# EasyEDA Pro project wavie-main-board-v0.1.epro, board PCB2
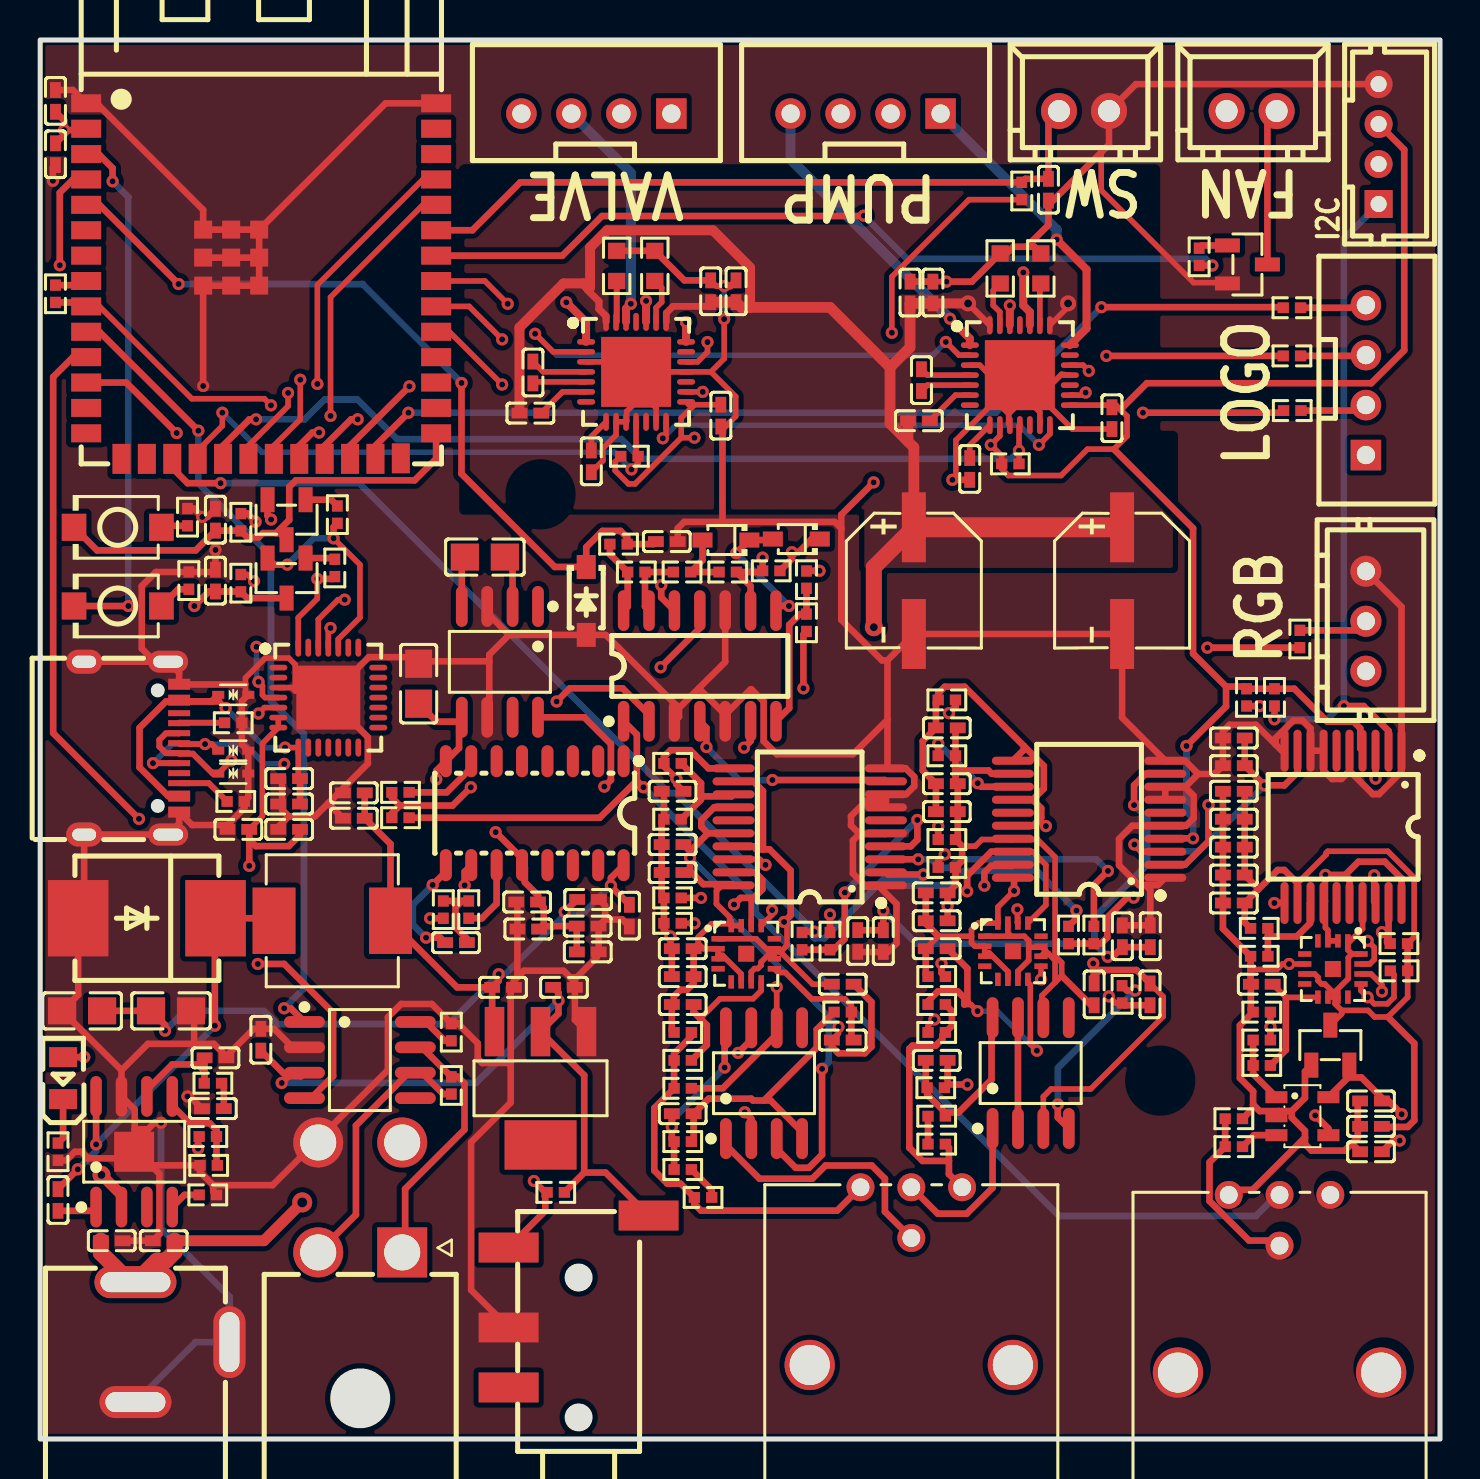
[diagram p1: board, top side]
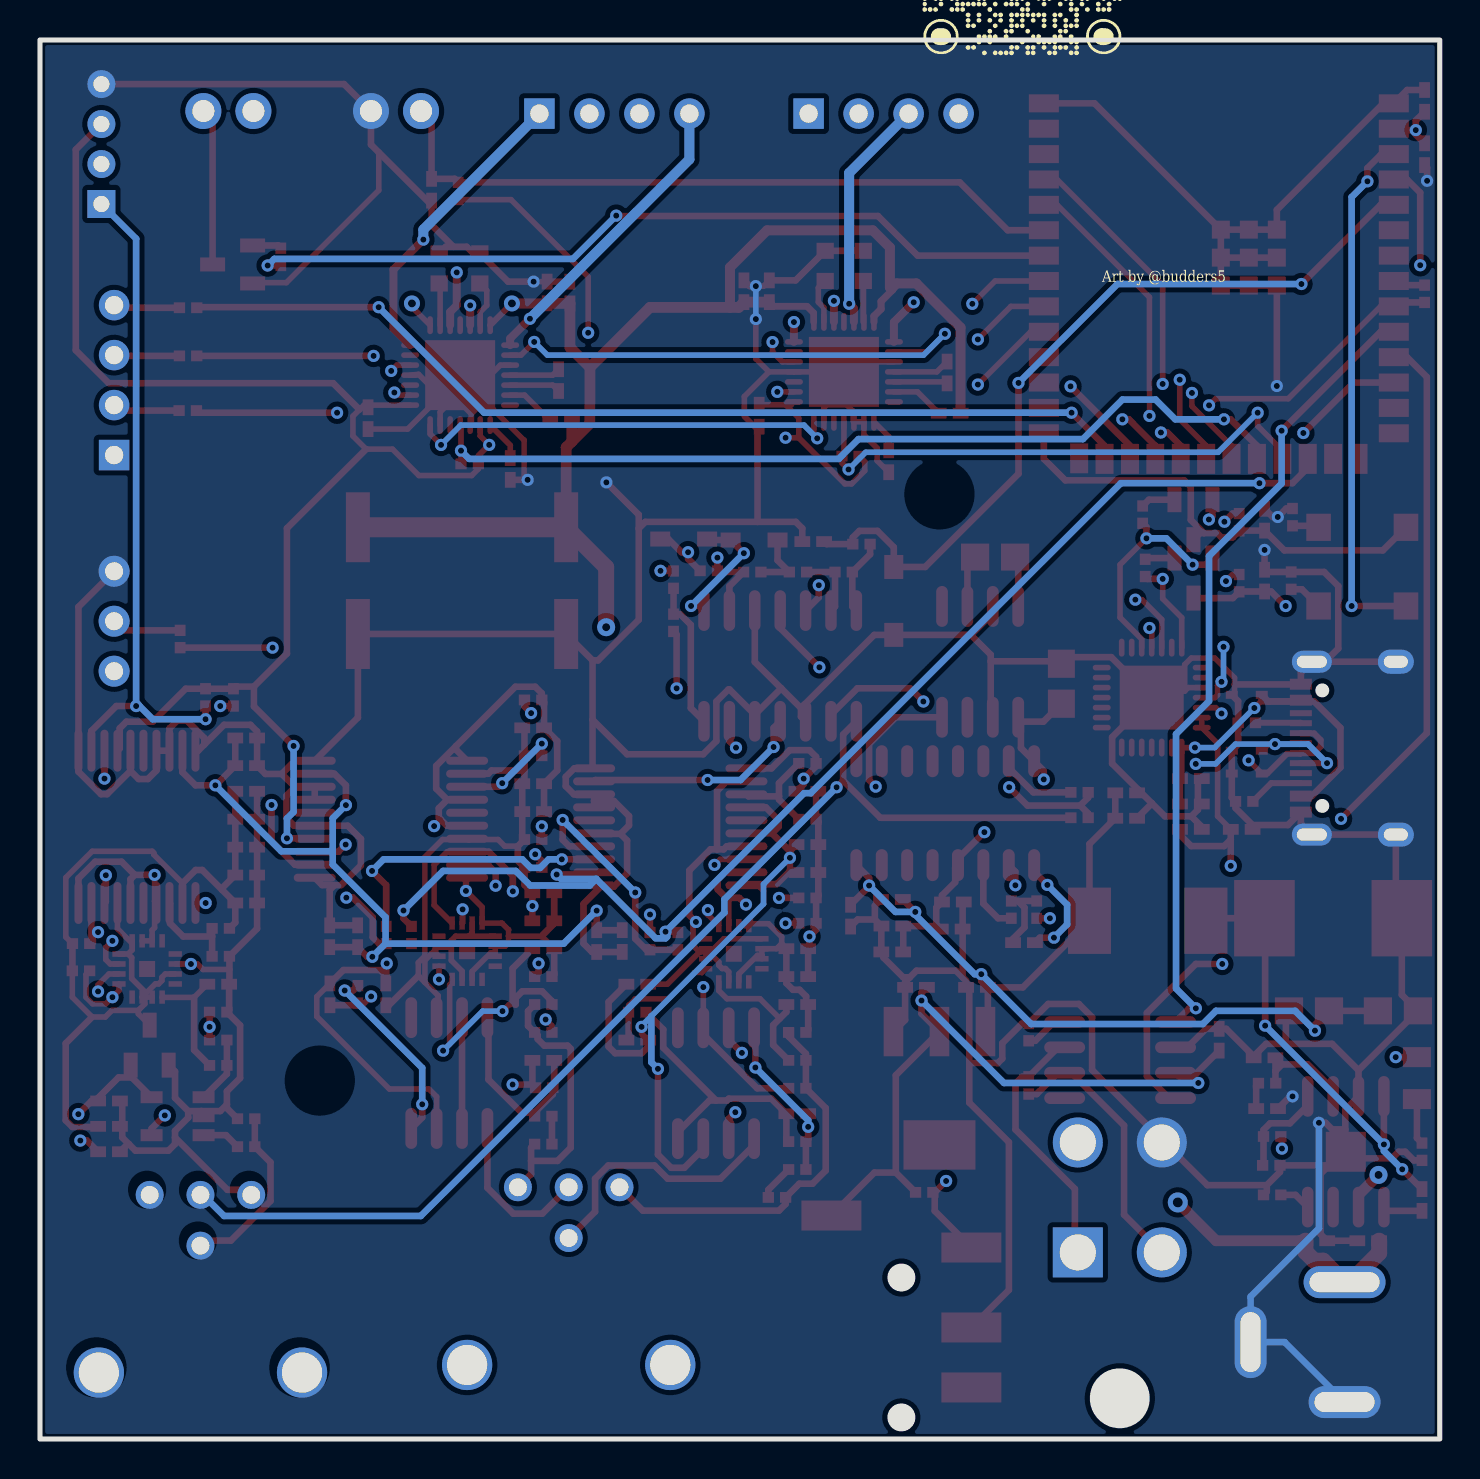
[diagram p2: board, bottom side, seen from below]

Outline 70 x 70 mm; copper layers: Top Layer, Inner1, Inner2, Bottom Layer. Coordinates in mm from the lower left corner of the outline.
Outline path: rectangle 0,70 70,0
Stack: Top Layer 0.035mm Outer layer thickness 1oz / Dielectric1 0.2104mm 7628 RC49% 8.6mil / Inner1 0.0152mm Inner layer thickness / Dielectric2 1.065mm 1.1mm H/HOZ Copper / Inner2 0.0152mm Inner layer thickness / Dielectric3 0.2104mm 7628 RC49% 8.6mil / Bottom Layer 0.035mm Outer layer thickness 1oz

## Design rules (mm)
template: Custom Config
spacing copperThickness1oz (default): track to track 0.102, other pairs 0.152 to 0.3
spacing copperThickness2oz: track to track 0.203, other pairs 0.152 to 0.3
spacing copperThicknessInner0.5oz: track to track 0.089, other pairs 0.152 to 0.3
track width copperThickness1oz (default): min 0.25, default 0.33, max 2.54
track width copperThickness2oz: min 0.5, default 0.5, max 2.54
track width copperThickness0.5oz: min 0.089, default 0.254, max 2.54
track width THIC: min 0.66, default 1, max 2.54
differential pair differentialPair (default): width min 0.127, default 0.254, max 2.54; gap min 0.152, default 0.152
via viaSize (default): diameter min 0.3, default 0.61, max 10; hole min 0.2, default 0.305, max 6.3
net GND uses GNDPOURTHERMAL
net VCC uses THIC, copperThickness2oz

## Placement (name value [footprint] x y rotation side)
Boot  SKRKAEE020  [SW-SMD_L3.9-W3.0-P4.45]  3.88 45.62 180 top
C1  100uF  [CAP-SMD_BD6.3-L6.6-W6.6-LS7.2-FD]  43.69 42.95 270 top
C2  100nF  [C0402]  33.53 57.43 270 top
C3  100nF  [C0402]  34.8 57.43 270 top
C4  22nF  [C0402]  24.64 53.36 270 top
C5  100nF  [C0402]  24.51 51.33 0 top
C7  100nF  [C0402]  34.04 51.2 90 top
C8  100uF  [CAP-SMD_BD6.3-L6.6-W6.6-LS7.2-FD]  54.1 42.95 270 top
C9  100nF  [C0402]  43.5 57.36 270 top
C10  100nF  [C0402]  44.64 57.36 270 top
C11  22nF  [C0402]  44.07 52.98 270 top
C12  100nF  [C0402]  43.94 50.95 0 top
C14  100nF  [C0402]  53.59 51.08 90 top
C16  100nF  [C0402]  0.76 66.95 270 top
C17  100nF  [C0402]  8.76 42.95 270 top
C18  100nF  [C0402]  8.76 46 270 top
C21  100nF  [C0402]  9.91 30.5 0 top
C22  100nF  [C0402]  12.45 31.77 0 top
C25  100nF  [C0402]  0.89 11.96 90 top
C26  39pF  [C0402]  8.76 19.07 180 top
C27  6.8nF  [C0402]  8.64 16.53 0 top
C36  100nF  [C0402]  11.03 19.98 270 top
C37  100nF  [C0402]  50.42 62.51 90 top
C42  100nF  [C0402]  27.4 27 180 top
C45  100nF  [C0402]  27.38 25.66 180 top
C47  100nF  [C0402]  15.68 31.06 0 top
C49  100nF  [C0402]  27.38 24.37 0 top
C55  100nF  [C0402]  42.16 24.91 90 top
C57  100nF  [C0402]  31.62 29.74 180 top
C59  100nF  [C0402]  31.62 32.41 180 top
C60  100nF  [C0402]  32.13 23.14 180 top
C61  100nF  [C0402]  32.13 24.53 180 top
C64  100nF  [C0402]  40.13 22.76 180 top
C65  1nF  [C0402]  32.13 16.28 0 top
C66  4.7uF  [C0402]  27.56 48.92 90 top
C67  4.7uF  [C0402]  46.48 48.54 90 top
C68  1.5nF  [C0402]  20.79 24.84 0 top
C69  20pF  [C0402]  31.33 44.9 180 top
C70  10nF  [C0402]  66.55 16.91 180 top
C71  10nF  [C0402]  61.09 22.76 0 top
C72  10uF  [C0402]  0.76 64.28 90 top
C73  10uF  [C0402]  12.45 30.5 0 top
C74  10uF  [C0402]  12.45 33.04 0 top
C75  10uF  [C0402]  26.19 22.6 180 top
C76  10uF  [C0402]  23.14 22.6 180 top
C77  10uF  [C0402]  29.46 26.18 90 top
C78  10uF  [C0402]  24.35 26.87 180 top
C79  10uF  [C0402]  15.68 32.33 0 top
C80  10uF  [C0402]  31.62 28.34 180 top
C81  10uF  [C0402]  40.88 24.92 90 top
C83  10uF  [C0402]  24.41 25.52 180 top
C84  1uF  [C0402]  32.13 21.74 0 top
C85  1uF  [C0402]  40.13 19.96 0 top
C86  1uF  [C0402]  66.55 14.37 0 top
C87  1uF  [C0402]  66.55 15.64 0 top
C90  47uF  [C0805]  2.1 21.42 0 top
C91  47uF  [C0805]  6.54 21.42 180 top
C92  2.2uF  [C0402]  6.18 9.92 0 top
C93  2.2uF  [C0402]  3.58 9.92 180 top
C94  100uF  [C0805]  18.92 37.79 270 top
C95  100uF  [C0805]  22.24 44.13 0 top
C96  100nF  [C0402]  54.12 25.16 270 top
C97  100nF  [C0402]  45.34 32.79 0 top
C98  100nF  [C0402]  45.34 35.58 0 top
C99  100nF  [C0402]  44.83 25.93 0 top
C100  100nF  [C0402]  44.83 27.33 0 top
C101  100nF  [C0402]  52.7 22.25 270 top
C102  1nF  [C0402]  44.83 18.95 0 top
C103  10uF  [C0402]  45.34 31.39 0 top
C104  10uF  [C0402]  55.51 25.16 270 top
C105  1uF  [C0402]  44.83 24.53 0 top
C106  1uF  [C0402]  55.5 22.25 270 top
C107  100nF  [C0402]  59.69 35.07 0 top
C108  100nF  [C0402]  59.69 28.22 0 top
C109  100nF  [C0402]  59.69 29.61 0 top
C110  100nF  [C0402]  59.69 31.01 0 top
C111  100nF  [C0402]  59.69 32.41 0 top
C114  10uF  [C0402]  59.69 26.82 0 top
C115  10uF  [C0402]  59.69 33.69 0 top
D1  LESD5D5.0CT1G  [SOD-523_L1.2-W0.8-LS1.6-BI]  9.65 33.3 180 top
D2  LESD5D5.0CT1G  [SOD-523_L1.2-W0.8-LS1.6-BI]  9.65 34.44 180 top
D3  LESD5D5.0CT1G  [SOD-523_L1.2-W0.8-LS1.6-BI]  9.65 37.23 180 top
D4  B560C-13-F  [SMC_L7.1-W6.2-LS8.1-RD]  5.33 26.06 180 top
D5  1N4148WS  [SOD-323_L1.8-W1.3-LS2.5-RD]  34.29 44.98 180 top
D6  1N4148WS  [SOD-323_L1.8-W1.3-LS2.5-RD]  37.81 45.03 180 top
D7  1N5819W  [SOD-123_L2.7-W1.6-LS3.7-RD-1]  27.3 41.93 270 top
DC1  PJ-002A  [DC-IN-TH_PJ-002A]  7.11 4.85 90 top
L1  10uH  [IND-SMD_L7.1-W6.6]  14.61 25.93 0 top
LED1  SZYY0805G  [LED0805-R-RD]  1.14 18.06 90 top
Q1  MMBT9014C  [SOT-23-3_L2.9-W1.3-P1.90-LS2.4-BR]  12.32 43.08 90 top
Q2  MMBT9014C  [SOT-23-3_L2.9-W1.3-P1.90-LS2.4-BR]  12.32 46 90 top
Q3  IRLML2502  [SOT-23-3_L2.9-W1.3-P1.90-LS2.4-BR]  60.37 58.77 180 top
R5  10kΩ  [R0402]  14.73 43.58 90 top
R6  10kΩ  [R0402]  14.86 46.25 90 top
R7  10kΩ  [R0402]  10.03 42.82 90 top
R8  1kΩ  [R0402]  7.43 42.95 270 top
R9  10kΩ  [R0402]  10.03 45.87 90 top
R10  1kΩ  [R0402]  7.37 46.12 270 top
R11  5.1kΩ  [R0402]  9.78 31.9 180 top
R12  5.1kΩ  [R0402]  9.65 35.84 180 top
R13  1kΩ  [R0402]  0.76 57.3 90 top
R14  10kΩ  [R0402]  29.46 49.17 180 top
R15  10kΩ  [R0402]  48.51 48.79 180 top
R16  100kΩ  [R0402]  8.38 12.21 180 top
R17  13kΩ  [R0402]  8.64 17.8 180 top
R18  270kΩ  [R0402]  8.38 15.14 180 top
R19  51kΩ  [R0402]  8.42 13.69 0 top
R32  10kΩ  [R0402]  20.56 20.36 90 top
R34  10kΩ  [R0402]  49.09 62.44 270 top
R35  100kΩ  [R0402]  57.96 59.15 270 top
R41  100kΩ  [R0402]  21.43 26.49 270 top
R42  10kΩ  [R0402]  20.16 26.49 90 top
R51  10kΩ  [R0402]  28.92 44.78 0 top
R53  10kΩ  [R0402]  39.49 24.91 270 top
R54  10kΩ  [R0402]  38.1 24.91 270 top
R55  10kΩ  [R0402]  31.62 33.8 0 top
R56  30kΩ  [R0402]  31.62 31.01 180 top
R57  10kΩ  [R0402]  31.62 27.07 180 top
R58  10kΩ  [R0402]  31.62 25.8 180 top
R59  10kΩ  [R0402]  32.13 18.95 180 top
R60  10kΩ  [R0402]  40.13 21.36 180 top
R61  100kΩ  [R0402]  32.13 13.48 180 top
R62  51kΩ  [R0402]  33.15 12.09 0 top
R63  51kΩ  [R0402]  18.02 32.36 180 top
R64  10kΩ  [R0402]  32.13 17.55 180 top
R65  10kΩ  [R0402]  32.13 20.34 180 top
R66  1MΩ  [R0402]  32.13 14.88 0 top
R68  4.02kΩ  [R0402]  0.89 14.37 90 top
R69  120Ω  [R0402]  20.56 17.69 90 top
R70  8.2kΩ  [R0402]  61.09 21.36 0 top
R71  300kΩ  [R0402]  61.09 19.96 180 top
R72  4.7kΩ  [R0402]  59.69 14.63 0 top
R73  7.5kΩ  [R0402]  59.69 16.02 180 top
R74  220Ω  [R0402]  61.09 18.69 0 top
R75  2kΩ  [R0402]  18.02 31.09 0 top
R81  820Ω  [R0402]  38.32 40.84 90 top
R82  4.7kΩ  [R0402]  25.78 12.34 0 top
R83  110mΩ  [R0603]  48.01 58.57 90 top
R84  110mΩ  [R0603]  50.04 58.57 90 top
R85  110mΩ  [R0603]  28.83 58.7 90 top
R86  110mΩ  [R0603]  30.73 58.7 90 top
R87  10kΩ  [R0402]  52.69 25.22 270 top
R88  10kΩ  [R0402]  51.42 25.22 270 top
R89  10kΩ  [R0402]  45.34 36.98 0 top
R90  30kΩ  [R0402]  45.34 34.19 0 top
R91  10kΩ  [R0402]  45.34 29.99 0 top
R92  10kΩ  [R0402]  45.34 28.6 0 top
R93  10kΩ  [R0402]  44.83 21.74 0 top
R94  10kΩ  [R0402]  54.1 22.25 90 top
R95  100kΩ  [R0402]  44.83 16.15 0 top
R96  51kΩ  [R0402]  44.83 14.75 180 top
R97  10kΩ  [R0402]  44.83 20.34 0 top
R98  10kΩ  [R0402]  44.83 23.14 180 top
R100  200kΩ  [R0402]  44.79 17.58 0 top
R101  10kΩ  [R0402]  60.33 37.11 90 top
R102  10kΩ  [R0402]  61.72 37.11 90 top
R103  10kΩ  [R0402]  60.96 24.15 0 top
R104  30kΩ  [R0402]  60.96 25.55 180 top
R105  10kΩ  [R0402]  67.95 24.79 0 top
R106  10kΩ  [R0402]  67.95 23.43 0 top
R107  470Ω  [R0402]  62.99 40.03 90 top
R108  36kΩ  [R0402]  38.32 43 90 top
R109  36kΩ  [R0402]  36.56 43.44 0 top
R110  36kΩ  [R0402]  34.38 43.38 180 top
R111  36kΩ  [R0402]  32.1 43.38 180 top
R112  36kΩ  [R0402]  29.81 43.38 180 top
R113  100Ω  [R0402]  62.59 54.19 0 top
R114  100Ω  [R0402]  62.59 56.6 0 top
R115  150Ω  [R0402]  62.61 51.46 0 top
Reset  SKRKAEE020  [SW-SMD_L3.9-W3.0-P4.45]  3.88 41.68 180 top
U1  ESP32-S3-WROOM-1-N16R8  [WIRELM-SMD_ESP32-S3-WROOM-1]  11.05 57.93 0 top
U2  TMC2209-LA  [QFN-28_L5.0-W5.0-P0.50-BL-EP]  29.8 53.39 270 top
U3  TMC2209-LA  [QFN-28_L5.0-W5.0-P0.50-BL-EP]  48.99 53.23 270 top
U4  TPS54360DDAR  [SOIC-8_L5.0-W4.0-P1.27-LS6.0-BL-EP2.0]  4.7 14.37 0 top
U5  AMS1117-3.3  [SOT-223-4_L6.5-W3.5-P2.30-LS7.0-BR]  25.02 17.55 90 top
U7  B4B-XH-A-G  [CONN-TH_B4B-XH-A-G]  27.81 66.32 180 top
U8  CP2102-GMR  [WQFN-28_L5.0-W5.0-P0.50-BL-EP3.2]  14.41 37.1 270 top
U9  B4B-XH-A-G  [CONN-TH_B4B-XH-A-G]  41.27 66.32 180 top
U11  SN65HVD230DR  [SOIC-8_L4.9-W3.9-P1.27-LS6.0-BL]  15.99 18.96 270 top
U12  B2B-XH-A  [CONN-TH_XH-2A]  52.2 66.44 0 top
U13  B2B-XH-A  [CONN-TH_XH-2A]  60.58 66.44 0 top
U14  B4B-PH-K-S-GW  [CONN-TH_B4B-PH-K-S-GW]  66.93 64.79 90 top
U15  1724480004  [CONN-TH_4P-P4.20_1724480004]  16 12.09 0 top
U16  031-6575  [CONN_6575_AMP]  43.56 12.6 0 top
U17  TP5551-TR  [SOT-23-5_L3.0-W1.7-P0.95-LS2.8-BR]  63.12 16.15 180 top
U18  XC6206P302MR  [SOT-23-3_L2.9-W1.3-P1.90-LS2.4-BR]  64.52 19.71 270 top
U19  CD4060BM  [SOP-16_L9.9-W3.9-P1.27-LS6.1-BL]  24.73 31.31 180 top
U20  LM2660M  [SOIC-8_L4.9-W3.9-P1.27-LS6.0-BL]  22.99 38.88 180 top
U22  TL074IM/TR  [SOIC-14_L8.6-W3.9-P1.27-LS6.0-BL]  32.98 38.68 0 top
U23  031-6575  [CONN_6575_AMP]  61.98 12.21 0 top
U24  KH-PJ-320D-SMT  [AUDIO-SMD_KH-PJ-320D-SMT_1]  26.92 6.88 90 top
U26  LMP7721MAX/NOPB  [SOIC-8_L4.9-W3.9-P1.27-LS6.0-BL]  36.2 17.8 0 top
U27  ADS1119IRTER  [WQFN-16_L3.0-W3.0-P0.50-BL-EP0.8]  35.31 24.28 270 top
U28  ADM3260ARSZ  [SSOP-20_L7.5-W5.2-P0.65-LS8.0-TL]  38.48 30.63 180 top
U29  LMP7721MAX/NOPB  [SOIC-8_L4.9-W3.9-P1.27-LS6.0-BL]  49.53 18.31 0 top
U30  ADS1119IRTER  [WQFN-16_L3.0-W3.0-P0.50-BL-EP0.8]  48.64 24.41 270 top
U31  ADM3260ARSZ  [SSOP-20_L7.5-W5.2-P0.65-LS8.0-TL]  52.45 31.01 180 top
U33  ADS1119IRTER  [WQFN-16_L3.0-W3.0-P0.50-BL-EP0.8]  64.64 23.52 180 top
U34  ADM3260ARSZ  [SSOP-20_L7.5-W5.2-P0.65-LS8.0-TL]  65.15 30.63 270 top
U35  B3B-XH-A(LF)(SN)  [CONN-TH_3P-P2.50_A2501WV2-3P]  66.29 40.92 90 top
U36  B4B-XH-A-G  [CONN-TH_B4B-XH-A-G]  66.29 52.98 90 top
USB1  TYPE-C 16PIN 2MD(073)  [USB-C-SMD_TYPE-C-6PIN-2MD-073]  4.57 34.57 270 top

## Footprints (pads in the part's own frame, mm; a bottom-side part is the same pattern mirrored in y, then rotated)
AUDIO-SMD_KH-PJ-320D-SMT_1
  rect 1.5x3 smd: 1(4.3,-3.5) 2(-4.3,3.5) 3(-1.3,3.5) 4(2.7,3.5)
C0402
  rect 0.79x0.54 smd: 1(-0.545,0) 2(0.545,0)
C0805
  rect 1.41x1.35 smd: 1(-1,0) 2(1,0)
CAP-SMD_BD6.3-L6.6-W6.6-LS7.2-FD
  rect 3.5x1.2 smd: 1(-2.67,0) 2(2.67,0)
CONN-TH_3P-P2.50_A2501WV2-3P
  round 1.55 hole 0.9: 1(-2.5,0) 2(0,0) 3(2.5,0)
CONN-TH_4P-P4.20_1724480004
  rect 2.5x2.5 hole 1.8: 1(2.1,-2.75)
  round 2.5 hole 1.8: 2(-2.1,-2.75) 3(2.1,2.75) 4(-2.1,2.75)
CONN-TH_B4B-PH-K-S-GW
  rect 1.4x1.4 hole 0.8: 1(-3,0)
  round 1.4 hole 0.8: 2(-1,0) 3(1,0) 4(3,0)
CONN-TH_B4B-XH-A-G
  rect 1.524x1.524 hole 0.914: 1(-3.75,0)
  round 1.524 hole 0.914: 2(-1.25,0) 3(1.25,0) 4(3.75,0)
CONN-TH_XH-2A
  round 1.8 hole 1.1: 1(-1.251,0) 2(1.251,0)
CONN_6575_AMP
  round 1.397 hole 0.889: 1(-2.54,0) 2(0,0) 3(2.54,0) 4(0,-2.54)
  round 2.514 hole 2.006: 5(-5.08,-8.89) 6(5.08,-8.89)
DC-IN-TH_PJ-002A
  oval 1.6x4.1 hole 1x3.5: 1(3,2.35)
  oval 1.6x3.6 hole 1x3: 2(-3,2.35)
  oval 3.6x1.6 hole 3x1: 3(0,-2.35)
IND-SMD_L7.1-W6.6
  rect 2.15x3.32 smd: 1(-2.913,0) 2(2.913,0)
LED0805-R-RD
  rect 1x1.399 smd: 1(1.05,0) 2(-1.05,0)
QFN-28_L5.0-W5.0-P0.50-BL-EP
  oval 0.28x0.9 smd: 1(-1.502,-2.5) 2(-1.001,-2.5) 3(-0.5,-2.5) 4(0,-2.5) 5(0.5,-2.5) 6(1,-2.5) 7(1.501,-2.5) 15(1.501,2.5) 16(1,2.5) 17(0.5,2.5) 18(0,2.5) 19(-0.5,2.5) 20(-1.001,2.5) 21(-1.502,2.5)
  oval 0.9x0.28 smd: 8(2.5,-1.502) 9(2.5,-1.001) 10(2.5,-0.5) 11(2.5,0) 12(2.5,0.5) 13(2.5,1) 14(2.5,1.501) 22(-2.5,1.501) 23(-2.5,1) 24(-2.5,0.5) 25(-2.5,0) 26(-2.5,-0.5) 27(-2.5,-1.001) 28(-2.5,-1.502)
  rect 3.5x3.5 smd: 29(0,0)
R0402
  rect 0.566x0.54 smd: 1(-0.433,0) 2(0.433,0)
R0603
  rect 0.806x0.864 smd: 1(-0.753,0) 2(0.753,0)
SMC_L7.1-W6.2-LS8.1-RD
  rect 3.03x3.82 smd: 1(-3.435,0) 2(3.435,0)
SOD-123_L2.7-W1.6-LS3.7-RD-1
  rect 1.2x0.95 smd: 1(-1.7,0) 2(1.7,0)
SOD-323_L1.8-W1.3-LS2.5-RD
  rect 1x0.75 smd: 1(-1.173,0) 2(1.173,0)
SOD-523_L1.2-W0.8-LS1.6-BI
  rect 0.6x0.4 smd: 1(-0.75,0) 2(0.75,0)
SOIC-8_L4.9-W3.9-P1.27-LS6.0-BL
  oval 0.588x2.045 smd: 1(-1.905,-2.772) 2(-0.635,-2.772) 3(0.635,-2.772) 4(1.905,-2.772) 5(1.905,2.772) 6(0.635,2.772) 7(-0.635,2.772) 8(-1.905,2.772)
SOIC-8_L5.0-W4.0-P1.27-LS6.0-BL-EP2.0
  oval 0.574x2.038 smd: 1(-1.905,-2.769) 2(-0.635,-2.769) 3(0.635,-2.769) 4(1.905,-2.769) 5(1.905,2.769) 6(0.635,2.769) 7(-0.635,2.769) 8(-1.905,2.769)
  rect 2x2 smd: 9(0,0)
SOIC-14_L8.6-W3.9-P1.27-LS6.0-BL
  oval 0.574x2.038 smd: 1(-3.81,-2.769) 2(-2.54,-2.769) 3(-1.27,-2.769) 4(0,-2.769) 5(1.27,-2.769) 6(2.54,-2.769) 7(3.81,-2.769) 8(3.81,2.769) 9(2.54,2.769) 10(1.27,2.769) 11(0,2.769) 12(-1.27,2.769) 13(-2.54,2.769) 14(-3.81,2.769)
SOP-16_L9.9-W3.9-P1.27-LS6.1-BL
  oval 0.6x1.6 smd: 1(-4.445,-2.6) 2(-3.175,-2.6) 3(-1.905,-2.6) 4(-0.635,-2.6) 5(0.635,-2.6) 6(1.905,-2.6) 7(3.175,-2.6) 8(4.445,-2.6) 9(4.445,2.6) 10(3.175,2.6) 11(1.905,2.6) 12(0.635,2.6) 13(-0.635,2.6) 14(-1.905,2.6) 15(-3.175,2.6) 16(-4.445,2.6)
SOT-23-3_L2.9-W1.3-P1.90-LS2.4-BR
  rect 1.25x0.7 smd: 1(1,-0.95) 2(1,0.95) 3(-1,0)
SOT-23-5_L3.0-W1.7-P0.95-LS2.8-BR
  rect 1.1x0.6 smd: 1(1.3,-0.95) 2(1.3,0) 3(1.3,0.95) 4(-1.3,0.95) 5(-1.3,-0.95)
SOT-223-4_L6.5-W3.5-P2.30-LS7.0-BR
  rect 2.47x0.98 smd: 1(2.835,-2.3) 2(2.835,0) 3(2.835,2.3)
  rect 2.47x3.6 smd: 4(-2.835,0)
SSOP-20_L7.5-W5.2-P0.65-LS8.0-TL
  oval 2.1x0.4 smd: 1(-3.81,2.926) 2(-3.81,2.276) 3(-3.81,1.625) 4(-3.81,0.976) 5(-3.81,0.325) 6(-3.81,-0.325) 7(-3.81,-0.976) 8(-3.81,-1.625) 9(-3.81,-2.276) 10(-3.81,-2.926) 11(3.81,-2.926) 12(3.81,-2.276) 13(3.81,-1.625) 14(3.81,-0.976) 15(3.81,-0.325) 16(3.81,0.325) 17(3.81,0.976) 18(3.81,1.625) 19(3.81,2.276) 20(3.81,2.926)
SW-SMD_L3.9-W3.0-P4.45
  rect 1.23x1.36 smd: 1(-2.185,0) 2(2.185,0)
USB-C-SMD_TYPE-C-6PIN-2MD-073
  rect 0.55x1.1 smd: 1(-3.2,2.375) 2(-2.4,2.375) 11(2.4,2.375) 12(3.2,2.375)
  rect 0.3x1.1 smd: 3(-1.75,2.375) 4(-1.25,2.375) 5(-0.75,2.375) 6(-0.25,2.375) 7(0.25,2.375) 8(0.75,2.375) 9(1.25,2.375) 10(1.75,2.375)
  oval 1.1x2 hole 0.6x1.5: 13(-4.325,1.825) 14(4.325,1.825)
  oval 1.2x1.8 hole 0.6x1.2: 13(-4.325,-2.375) 14(4.325,-2.375)
WIRELM-SMD_ESP32-S3-WROOM-1
  rect 1.5x0.9 smd: 1(-8.75,8.895) 2(-8.75,7.625) 3(-8.75,6.355) 4(-8.75,5.085) 5(-8.75,3.815) 6(-8.75,2.545) 7(-8.75,1.275) 8(-8.75,0.005) 9(-8.75,-1.265) 10(-8.75,-2.535) 11(-8.75,-3.805) 12(-8.75,-5.075) 13(-8.75,-6.345) 14(-8.75,-7.615) 27(8.75,-7.615) 28(8.75,-6.345) 29(8.75,-5.075) 30(8.75,-3.805) 31(8.75,-2.535) 32(8.75,-1.265) 33(8.75,0.005) 34(8.75,1.275) 35(8.75,2.545) 36(8.75,3.815) 37(8.75,5.085) 38(8.75,6.355) 39(8.75,7.625) 40(8.75,8.895)
  rect 0.9x1.5 smd: 15(-6.985,-8.895) 16(-5.715,-8.895) 17(-4.445,-8.895) 18(-3.175,-8.895) 19(-1.905,-8.895) 20(-0.635,-8.895) 21(0.635,-8.895) 22(1.905,-8.895) 23(3.175,-8.895) 24(4.445,-8.895) 25(5.715,-8.895) 26(6.985,-8.865)
  rect 0.9x0.9 smd: 41(-2.9,2.575) 41(-2.9,1.175) 41(-2.9,-0.225) 41(-1.5,2.575) 41(-1.5,1.175) 41(-1.5,-0.225) 41(-0.1,2.575) 41(-0.1,1.175) 41(-0.1,-0.225)
WQFN-16_L3.0-W3.0-P0.50-BL-EP0.8
  rect 0.28x0.665 smd: 1(-0.75,-1.407) 2(-0.25,-1.407) 3(0.25,-1.407) 4(0.75,-1.407) 9(0.75,1.407) 10(0.25,1.407) 11(-0.25,1.407) 12(-0.75,1.407)
  rect 0.665x0.28 smd: 5(1.407,-0.75) 6(1.407,-0.25) 7(1.407,0.25) 8(1.407,0.75) 13(-1.407,0.75) 14(-1.407,0.25) 15(-1.407,-0.25) 16(-1.407,-0.75)
  rect 0.8x0.8 smd: 17(0,0)
WQFN-28_L5.0-W5.0-P0.50-BL-EP3.2
  oval 0.28x0.9 smd: 1(-1.502,-2.5) 2(-1.001,-2.5) 3(-0.5,-2.5) 4(0,-2.5) 5(0.5,-2.5) 6(1,-2.5) 7(1.501,-2.5) 15(1.501,2.5) 16(1,2.5) 17(0.5,2.5) 18(0,2.5) 19(-0.5,2.5) 20(-1.001,2.5) 21(-1.502,2.5)
  oval 0.9x0.28 smd: 8(2.5,-1.502) 9(2.5,-1.001) 10(2.5,-0.5) 11(2.5,0) 12(2.5,0.5) 13(2.5,1) 14(2.5,1.501) 22(-2.5,1.501) 23(-2.5,1) 24(-2.5,0.5) 25(-2.5,0) 26(-2.5,-0.5) 27(-2.5,-1.001) 28(-2.5,-1.502)
  rect 3.2x3.2 smd: 29(0,0)

## Nets
As in the schematic.

Pads without a net: U1 6 7 15 16 26 28 29 30 38 39; U2 7 12 17 20 25; U3 7 12 17 20 25; U4 3; U5 4; U8 1 2 9 10 11 12 13 14 15 16 17 18 19 20 21 22 23 27; U11 5; U16 5 6; U19 1 2 3 4 5 6 13 14 15; U20 1 7; U23 5 6; U24 2; U26 5; U27 4 5 12 17; U28 6 15; U29 5; U30 4 5 12 17; U31 6 15; U33 4 5 8 12 17; U34 6 15; USB1 3 9

## Via types
v1: diameter 0.61, hole 0.305, Top Layer to Bottom Layer, 186 vias
v2: diameter 0.8, hole 0.4, Top Layer to Bottom Layer, 2 vias
v3: diameter 1, hole 0.5, Top Layer to Bottom Layer, 1 via
v4: diameter 0.9, hole 0.4, Top Layer to Bottom Layer, 2 vias

## Routing (per net, layer and track width the routed paths; a pad name or vN(x,y) marks a point on that pad's centre or on a via; arc(x,y) is an arc through that point)
+3.3V: length 282.2
  Top Layer w0.28: 32.06,50.1 32.06,51.09 32.72,51.75 ; 32.06,50.1 v1(32.72,50.1) ; 32.06,50.1 29.75,47.79 29.42,47.79 28.76,48.45 28.76,48.9 R14.2 ; 32.72,51.75 C7.2 ; 32.72,51.75 32.44,51.75 U2.15 ; 53.47,51.73 53.59,51.62 ; 53.47,51.73 U3.15 ; 53.47,51.73 53.8,51.73 54.35,51.18 54.35,50.19 53.69,49.53 52.37,49.53 51.05,48.21 48.41,48.21 48.08,48.54 R15.2 48.08,49.2 v1(47.54,49.74) 47.99,50.19 U3.9 ; U8.6 U8.7 11.11,34.8 11.11,31.16 C21.2 ; v1(42.59,55.35) 42.59,58.15 46.45,62.01 R34.2 ; v1(10.69,42.92) 10.36,43.25 R7.2
  Top Layer w0.33: v1(1.2,65.49) 2.23,65.49 U1.2 ; v1(1.2,65.49) 1.2,65.27 C72.2 ; v1(1.2,65.49) 1.2,65.97 C16.2 ; U34.4 66.01,34.55 66.01,35.56 65.68,35.89 64.36,35.89 62.71,37.54 R102.2 R101.2 60.22,37.65 59.3,37.65 ; 27.2,13.33 27.2,18.2 U5.2 25.92,21.28 v1(25.92,21.94) 25.92,22.33 C75.2 ; 27.2,13.33 28.27,13.33 U24.1 ; 27.2,13.33 R82.2 ; v1(12.08,17.81) 12.41,18.14 ; 12.41,18.14 12.32,18.14 C36.2 ; 12.41,18.14 13.03,18.14 U11.3 ; v1(43.86,30.97) 43.86,29.98 43.53,29.65 U28.4 ; 10.45,30 10.45,30.5 ; 10.45,30 v1(10.45,28.68) ; 10.45,30 10.78,29.67 12.43,29.67 12.99,30.22 C73.2 ; R54.2 R53.2 39.68,24.48 40.23,25.03 v1(40.23,27.34) ; v1(54.68,27.09) 54.35,27.09 53.36,26.1 53.36,25.11 53.04,24.78 R87.2 R88.2 ; U31.4 56.28,30.06 v1(57.65,30.06) ; 59.3,37.65 59.3,36.66 v1(57.32,34.68) ; 59.3,37.65 57.65,39.3 57.65,45.57 53.69,49.53 ; v1(2.2,19.11) LED1.1 ; v1(10.77,45.89) 10.36,46.3 R9.2 ; U14.3 68.21,64.51 68.21,54.48 66.56,52.83 55.34,52.83 54.02,51.51
  Inner1 w0.28: v1(42.59,55.35) 47.54,50.4 v1(47.54,49.74)
  Inner1 w0.33: v1(43.86,30.97) 44.19,30.97 44.52,31.3 47.82,31.3 52.04,27.09 v1(54.68,27.09) ; v1(10.69,42.92) 10.69,45.49 10.77,45.56 v1(10.77,45.89)
  Inner2 w0.28: v1(47.54,49.74) 46.55,50.73 33.35,50.73 v1(32.72,50.1) ; v1(10.69,42.92) 10.69,41.97 10.12,41.4 10.12,35.94 10.45,35.61 v1(10.45,28.68)
  Inner2 w0.33: v1(10.45,28.68) 10.45,27.69 10.12,27.36 10.12,19.44 10.45,19.11 ; v1(1.2,65.49) 1.2,64.39 9.78,55.81 9.78,46.88 v1(10.77,45.89) ; v1(40.23,27.34) 39.57,27.34 34.95,22.72 26.7,22.72 v1(25.92,21.94) ; 10.45,19.11 v1(2.2,19.11) ; 10.45,19.11 10.78,19.11 v1(12.08,17.81) ; v1(57.65,30.06) v1(54.68,27.09)
  Bottom Layer w0.33: v1(25.92,21.94) 21.79,17.81 v1(12.08,17.81) ; v1(57.32,34.68) 57.32,31.38 57.65,31.05 v1(57.65,30.06) ; v1(43.86,30.97) v1(40.23,27.34)
+3VDO: length 8
  Top Layer w0.33: 65.41,18.09 65.41,18.65 U18.2 ; 65.41,18.09 U17.5 ; 65.41,18.09 66.07,18.09 67.09,17.07 C70.1 67.42,16.91 v1(68.08,16.25) ; v1(67.98,14.93) 67.65,14.93 C86.2
  Inner2 w0.33: v1(68.08,16.25) 68.08,15.03 v1(67.98,14.93)
+5V: length 176.5
  Top Layer w0.33: C107.2 C115.2 61.22,32.71 ; v1(42.16,26.44) C55.2 40.89,25.46 ; U20.8 27.2,36.11 28.54,34.77 28.54,32.97 v1(28.21,32.64) ; U28.9 42.22,32.97 v1(36.61,32.97) ; v1(54.7,31.72) 54.7,32.71 55.28,33.29 U31.9 ; C77.2 28.54,27.65 v1(28.54,27.69) 28.54,28.08 U19.16 ; C90.2 C91.2 6.24,20.72 v1(6.24,20.43) ; C76.2 22.6,20.5 U5.3 ; C76.2 20.85,22.6 L1.2 17.52,29.77 C47.2 C79.2 ; C76.2 22.93,22.93 v1(22.93,23.26) ; C104.2 C96.2 53.63,24.13 v1(53.38,24.13) ; v1(7.89,14.53) 7.89,15.08 R18.2 ; v1(26.23,26.37) C42.2 ; U34.9 62.88,33.37 62.22,32.71 v1(61.23,32.71) ; U22.4 33.32,35.58 v1(33.32,34.62)
  Inner1 w0.33: v1(6.24,20.43) 6.24,17.13 7.23,16.14 7.23,15.19 v1(7.89,14.53)
  Inner2 w0.33: U35.1 66.19,38.32 65.85,38.32 ; 30.85,30 v1(28.21,32.64) ; 30.85,30 32.98,32.14 32.98,34.29 v1(33.32,34.62) ; 30.85,30 v1(28.54,27.69) ; v1(36.61,32.97) 42.16,27.43 v1(42.16,26.44) ; 65.85,38.32 61.23,33.7 v1(61.23,32.71) ; 65.85,38.32 65.19,38.98 65.19,47.23 66.18,48.22 66.18,49.21 ; 66.18,49.21 59.33,56.06 U13.1 ; 66.18,49.21 66.27,49.21 U36.1
  Bottom Layer w0.33: 52.72,24.79 43.81,24.79 v1(42.16,26.44) ; 52.72,24.79 v1(53.38,24.13) ; 52.72,24.79 52.72,26.11 55.36,28.75 55.36,29.41 ; v1(6.24,20.43) 7.23,21.42 11.19,21.42 11.85,20.76 20.43,20.76 v1(22.93,23.26) 23.26,23.26 26.23,26.23 v1(26.23,26.37) 27.22,26.37 v1(28.54,27.69) ; v1(61.23,32.71) 57.93,29.41 55.36,29.41 ; v1(36.61,32.97) 34.96,32.97 v1(33.32,34.62) ; 55.36,29.41 55.36,31.06 v1(54.7,31.72)
GND: length 512.9
  Top Layer w0.28: D3.1 10.26,37.37 10.26,38.09 11.25,39.08 12.43,39.08 12.76,38.75 12.76,37.43 ; 30.65,53.39 U2.18 33.54,53.39 ; 30.65,53.39 30.65,51.74 ; 30.65,53.39 U2.29 29.3,53.89 U2.3 ; 47.44,51.62 48.1,51.62 48.43,51.29 ; 47.44,51.62 45.79,49.97 45.79,47.99 ; 47.44,51.62 47.44,53.27 46.98,53.73 U3.3 ; C66.1 28.14,48.95 28.14,49.57 28.8,50.23 U2.9 U2.10 29.33,50.92 29.33,51.41 29.66,51.74 30.65,51.74 ; 50.52,52.73 49.75,51.95 49.75,51.62 ; 50.52,52.73 51.07,53.27 U3.18 ; 50.52,52.73 50.52,51.62 51.61,50.53 C14.1 ; 34.12,50.51 34.78,51.17 34.78,52.16 33.54,53.39 ; 49.09,51.62 49.75,51.62 ; 49.09,51.62 48.76,51.62 48.43,51.29 ; 49.09,51.62 49.09,53.13 U3.29 ; 49.75,51.62 49.99,51.38 U3.13 ; 30.65,51.74 30.8,51.59 30.8,50.89 ; U3.10 48.43,50.79 48.43,51.29 ; v1(45.32,57.91) C10.1 ; 33.54,53.39 34.2,54.05 v1(34.2,56.03) ; 12.76,37.43 14.08,37.43 U8.29 ; 12.76,37.43 12.59,37.6 U8.3 ; 53.06,64.38 53.06,62.48 57.68,57.86 59.33,57.86 Q3.2 ; C2.1 33.82,57.68 v1(34.2,57.68)
  Top Layer w0.33: U11.2 12.62,19.6 11.69,20.52 C36.1 10.68,20.52 9.31,19.15 ; 40.06,45.56 39.73,45.89 34.12,45.89 ; 40.06,45.56 40.06,46.24 v1(41.68,47.86) ; 40.06,45.56 40.06,40.99 42.09,38.96 42.37,38.96 ; v1(8.15,52.69) U1.41 U1.41 U1.41 U1.41 ; 27.93,25.66 C49.2 27.82,24.27 27.82,24.09 26.83,23.1 26.5,23.1 ; U5.1 26.74,20.97 C75.1 26.74,22.87 26.5,23.1 ; 13.76,14.84 17.39,18.47 17.39,21.11 18.05,21.77 19.58,21.77 20.56,20.79 20.89,20.79 21.88,19.8 21.88,19.03 22.1,18.81 23.53,18.81 ; 13.76,14.84 11.62,12.7 8.65,12.7 ; 13.76,14.84 U15.4 ; 41.96,27.64 42.82,26.77 42.82,24.79 42.39,24.37 C55.1 40.89,24.37 ; 41.96,27.64 41.3,27.64 40.64,28.3 40.64,29.95 40.97,30.28 ; 41.96,27.64 U28.1 ; U1.41 U1.41 ; U1.41 U1.41 U1.41 ; U1.41 17.27,66.83 U1.40 ; U1.41 U1.41 U1.41 8.15,61.5 2.87,66.78 2.35,66.78 U1.1 1.63,67.5 C16.1 ; U24.3 21.55,7.46 21.55,14.85 23.53,16.83 23.53,18.81 ; 4.72,15.49 5.38,15.49 5.71,15.82 v1(6.04,15.82) ; 4.72,15.49 4.72,14.5 ; 4.72,15.49 4.72,16.48 4.06,17.14 4.07,18.45 ; 23.45,40.23 22.35,41.33 U20.3 ; 23.45,40.23 22.46,39.24 22.46,38.91 ; 23.45,40.23 D7.2 28.28,40.23 31.95,36.57 ; C27.1 7.48,17.14 v1(7.36,17.14) ; 15.07,32.48 15.07,32.4 C79.1 ; 15.07,32.48 16.39,33.8 16.39,35.12 U8.29 16.43,39.12 18.7,39.12 19.03,38.79 ; 15.07,32.48 14.41,31.82 ; R10.1 7.68,46.56 v1(8.1,46.13) 8.36,46.13 C18.1 ; 26.5,23.1 26.17,23.43 24.19,23.43 23.86,23.1 ; 34.26,36.24 35.52,37.5 35.58,37.5 36.18,36.9 36.18,34.92 36.84,34.26 40.64,34.26 42.37,35.99 ; 34.26,36.24 32.93,37.56 ; 34.26,36.24 U22.5 ; 5.54,13.69 5.38,13.69 U4.9 ; 5.54,13.69 7.99,13.69 7.99,13.36 8.65,12.7 ; 5.54,13.69 4.72,14.5 ; 5.54,13.69 5.96,13.27 5.96,10.25 C92.1 C93.1 ; 65.48,33.43 65.48,34.44 ; 65.48,33.43 66.64,32.26 66.95,32.26 68.08,33.39 U34.1 68.08,41.63 U35.3 ; 65.48,33.43 65.07,33.02 64.6,33.02 64.18,33.45 U34.7 U34.8 63.53,35.55 63.13,35.95 62.66,35.95 61.79,35.07 61.79,34.74 ; C45.1 28.25,25.99 ; 28.25,25.99 28.25,26.69 C42.1 ; 28.25,25.99 29.11,25.99 C77.1 ; 23.53,18.81 23.53,22.44 C76.1 23.69,22.93 23.86,23.1 ; 9.31,19.15 8.69,19.77 7.7,19.77 ; 9.31,19.15 C26.1 ; 57.91,33.28 57.25,32.62 ; 57.91,33.28 58.73,33.28 59.15,33.69 C107.1 59.14,35.4 59.48,35.73 60.8,35.73 61.79,34.74 ; 57.91,33.28 57.25,33.94 U31.10 54.1,36.1 C8.2 C1.2 42.37,38.96 ; 57.25,32.62 57.68,32.19 57.68,31.06 57.3,30.69 U31.5 54.61,30.69 53.95,30.03 53.95,28.71 54.94,27.72 55.27,27.72 ; 57.25,32.62 56.28,32.62 U31.8 U31.7 ; D3.1 10.09,36.92 R12.1 10.09,34.76 D2.1 D1.1 10.4,32.09 R11.1 10.21,31.57 9.36,30.72 ; R16.1 8.65,12.38 8.65,12.7 ; 31.95,36.57 31.95,36.14 U22.3 ; 31.95,36.57 32.93,37.56 ; 42.29,31.93 41.3,31.93 40.54,31.17 40.54,30.7 40.97,30.28 ; 42.29,31.93 U28.7 ; 42.29,31.93 U28.8 43.3,32.26 43.71,32.66 43.71,33.13 43.28,33.56 U28.10 42.37,33.63 42.37,35.99 ; 50.42,61.74 53.45,64.77 U12.2 54.8,67.79 U14.4 ; 50.42,61.74 C37.1 ; 50.42,61.74 50.42,60.75 49.33,59.65 ; 4.72,14.5 U4.9 ; U4.9 4.37,14.04 2.39,14.04 2.06,14.37 1.73,14.37 1.3,13.94 R68.1 ; 5.74,38.89 USB1.13 6.95,38.34 USB1.1 6.96,37.76 10.26,37.76 ; 5.74,38.89 5.08,39.55 5.08,42.68 5.78,43.38 8.65,43.38 C17.1 v1(8.76,44.48) ; 5.74,38.89 USB1.13 ; C96.1 C104.1 55.51,27.47 55.27,27.72 ; C78.2 23.86,26.81 23.86,23.1 ; 9.36,30.72 C21.1 ; 9.36,30.72 7.59,30.72 USB1.12 6.95,30.79 USB1.14 USB1.14 2.2,26.36 D4.2 1.9,22.23 C90.1 4.07,18.45 ; 34.12,45.89 32.2,45.89 31.88,45.56 C69.1 ; 34.12,45.89 34.12,50.58 C7.1 ; 61.79,34.74 62.09,34.44 U34.10 ; U20.6 22.46,36.22 22.46,38.91 ; 14.41,31.82 14.41,31.79 C47.1 ; 14.41,31.82 13.75,31.16 12.43,31.16 ; v1(45.61,47.99) C67.1 ; 7.7,19.77 5.39,19.77 4.07,18.45 ; 7.7,19.77 7.7,21.27 C91.1 ; v1(45.32,57.91) 46.59,57.91 R83.2 48.34,59.32 48.67,59.65 49.33,59.65 ; 55.27,27.72 55.89,27.72 U31.1 ; 49.33,59.65 49.71,59.65 R84.2 ; 22.46,38.91 19.16,38.91 19.03,38.79 ; C72.1 0.64,63.61 v1(0.64,62.95) ; 12.1,31.82 12.1,32.85 C74.1 ; 12.1,31.82 C22.1 ; 12.1,31.82 12.1,31.49 12.43,31.16 ; 40.97,30.28 42.26,30.28 U28.5 ; 32.93,37.56 34.26,38.88 U22.10 ; 42.37,35.99 42.37,38.96 ; C10.1 C9.1 ; 12.43,31.16 11.9,30.63 C73.1 ; C3.1 34.51,57.68 v1(34.2,57.68) ; R85.2 R86.2 32.21,57.97 C2.1 ; 19.03,38.79 C94.1
  Inner1 w0.33: v1(0.64,62.95) 8.15,55.44 v1(8.15,52.69)
  Inner2 w0.28: v1(34.2,57.68) 44.1,57.68 44.33,57.91 v1(45.32,57.91)
  Inner2 w0.33: v1(8.15,52.69) 8.15,51.37 8.76,50.75 8.76,50.42 8.1,49.76 v1(8.1,46.13) 8.76,45.47 v1(8.76,44.48) ; v1(6.04,15.82) v1(7.36,17.14) ; v1(41.68,47.86) 45.49,47.86 v1(45.61,47.99)
  Bottom Layer w0.28: v1(34.2,56.03) v1(34.2,57.68)
  Bottom Layer w0.33: v1(6.04,15.82) 6.04,10.54 9.46,7.12 DC1.3 7.76,4.85 4.76,1.85
VBUS: length 19.3
  Top Layer w0.28: v1(12.24,34.6) U8.8 12.9,33.13 C74.2 ; D3.2 8.94,36.91 v1(9.27,36.58)
  Top Layer w0.33: 8.94,36.91 8.57,36.91 ; 8.57,36.91 7.01,36.91 USB1.2 ; 8.57,36.91 D3.2 ; 8.57,36.9 6.29,36.9 4.97,35.58 4.97,33.6 6.4,32.17 USB1.11 ; C22.2 C74.2
  Bottom Layer w0.28: v1(12.24,34.6) 11.25,34.6 v1(9.27,36.58)
VCC: length 146.1
  Top Layer w0.28: U3.22 51.4,56.64 v2(51.4,56.82)
  Top Layer w0.31: v2(46.4,56.82) U3.28
  Top Layer w0.34: 31.31,55.89 31.31,56.34 31.64,56.67 33.32,56.67 C2.2
  Top Layer w0.36: U2.28 28.3,56.18 27.94,56.54 27.94,56.92 27.37,57.49 27.5,57.62
  Top Layer w0.5: 35.5,56.62 35.5,58.62 33.64,60.47 28.35,60.47 27.5,59.62 27.5,57.62 27.37,57.62 27.17,57.82 26.17,57.82 23.97,55.61 23.97,51.33 ; C10.2 v2(46.4,56.82)
  Top Layer w0.54: 43.4,49.91 C12.1 ; 43.4,49.91 42.5,50.81 42.5,53.62 ; 43.4,49.91 43.69,49.62 C1.1 ; v3(13.1,11.84) 11.19,9.92 C92.2 ; 42.5,53.62 39.5,56.62 35.06,56.62 C3.2 C2.2 ; 42.5,53.62 43.5,54.62 C9.2 C10.2 ; 4.06,11.6 4.06,12.21 v4(3.06,13.21)
  Top Layer w0.8: C92.2 6.72,9.36 6.28,8.92 5.83,8.92 4.76,7.85 4.49,7.85 3.03,9.31 C93.2 ; C1.1 41.69,43.62 v4(41.69,40.62)
  Top Layer w1: C1.1 C8.1
  Inner2 w0.5: v2(46.4,56.82) 47.4,55.82 50.4,55.82 v2(51.4,56.82)
  Inner2 w0.8: v4(41.69,40.62) 41.69,39.62 18.1,16.03 U15.3 15.1,11.84 v3(13.1,11.84) 4.44,11.84 v4(3.06,13.21)
-5: length 34.3
  Top Layer w0.33: v1(31.02,38.61) 32.98,40.57 U22.11 ; C94.2 19.82,35.89 20.95,35.89 ; 20.95,35.89 U20.5 ; 20.95,35.89 20.95,34.57 U19.8 19.8,33.43 v1(19.8,33) ; 26.83,24.38 C45.2 25.18,25.66 ; 25.18,25.66 25.1,25.66 C83.1 ; 25.18,25.66 25.18,26.58 C78.1 24.89,27.2 24.23,27.86 24.23,28.57 U19.12 24.1,29.04 v1(22.77,30.36)
  Inner1 w0.33: v1(22.77,30.36) 22.45,30.36 v1(19.8,33)
  Inner2 w0.33: v1(22.77,30.36) v1(31.02,38.61)
CAN_RX: length 45.5
  Top Layer w0.33: U1.11 1.64,54.13 0.65,53.14 0.65,35.32 v1(4.94,31.03) ; v1(10.88,23.77) 12.2,23.77 14.65,21.32 14.65,18.16 13.54,17.06 U11.4
  Inner1 w0.33: v1(4.94,31.03) 4.94,29.71 v1(10.88,23.77)
CAN_TX: length 40.5
  Top Layer w0.33: U11.1 12.53,21.55 v1(12.2,21.55) ; v1(7.91,50.45) 2.96,55.4 U1.10
  Bottom Layer w0.33: v1(12.2,21.55) 13.19,22.54 13.19,35.27 11.54,36.92 11.54,44.18 7.91,47.81 v1(7.91,50.45)
CANH: length 13
  Top Layer w0.33: U11.7 19.09,19.6 R69.2 20.89,18.12 21.22,17.79 21.22,15.48 18.25,12.51 18.25,9.48 U15.1
CANL: length 13.4
  Top Layer w0.33: U15.2 15.79,11.22 15.79,15.69 18.43,18.33 U11.6 19.09,18.33 20.16,17.26 R69.1
DO_ISOLATED_+5V: length 46.2
  Top Layer w0.28: 64.75,22.11 U33.11 64.75,22.25 ; 64.75,22.11 64.75,22.25 ; 64.75,22.11 U33.10 ; 64.75,22.11 64.75,21.78 65.08,21.45 ; 65.39,24.8 65.39,24.47 65.6,24.27 ; 65.39,24.8 66.13,25.53 U34.17 ; 65.39,24.8 U33.1 ; 64.75,22.25 64.75,22.38 65.41,23.04 65.41,24.09 65.6,24.27 ; 64.75,22.25 64.23,22.77 64.07,22.77 63.9,22.94 63.9,23.1 63.74,23.27 U33.7 ; 65.6,24.27 U33.16 ; R106.2 68.38,22.11 67.39,21.12 66.73,21.12 66.4,21.45 65.08,21.45 ; 65.08,21.45 65.08,21.28 U18.3 ; R105.2 68.71,25.12 68.71,28.09 67.39,29.41 64.39,29.41 64.31,29.33 64.31,29.24 62.88,27.81 U34.12
  Top Layer w0.33: C111.2 C110.2 C109.2 C108.2 60.89,27.56 60.89,27.48 ; 60.89,27.48 C114.2 60.23,25.84 R104.2 ; 60.89,27.48 61.89,28.47 62.21,28.47 62.88,27.81 ; C87.2 67.39,15.61 68.38,15.61 68.71,15.94 68.71,19.8 67.39,21.12 ; R105.2 68.38,23.43
DO_ISOLATED_GND: length 61.4
  Top Layer w0.28: 64.27,26.91 64.27,25.59 64.39,25.46 U33.3 U33.2 ; 64.27,26.91 U34.14 ; 64.27,26.91 v1(64.27,28.23) ; U33.15 66.49,23.77 66.71,23.99 66.71,24.6 v1(66.38,24.93) ; U33.6 v1(62.45,23.77) 62.12,23.77 61.85,23.49 60.53,23.49
  Top Layer w0.33: U34.20 68.08,28.05 67.24,28.89 65.92,28.89 65.26,28.23 ; 60.65,16.74 60.98,16.41 61.93,16.41 ; 60.65,16.74 60.65,16.56 R73.1 ; 60.65,16.74 60.65,17.4 59.99,18.06 59.99,20.7 R70.1 60.54,21.47 C71.1 60.53,22.77 R103.1 59.14,25.54 C114.1 C108.1 C109.1 C110.1 C111.1 ; C87.1 65.9,15.75 65.89,15.75 ; 65.56,14.76 65.62,14.76 C86.1 ; 65.56,14.76 65.89,15.09 65.89,15.75 ; 65.56,14.76 65.23,14.43 63.58,14.43 63.25,14.76 63.25,15.09 ; 61.93,16.41 62.59,16.41 ; 61.93,16.41 61.93,16.26 U17.2 ; 62.59,16.41 63.25,17.07 63.25,18.39 63.57,18.71 ; 62.59,16.41 62.59,16.08 63.25,15.42 63.25,15.09 ; v1(64.27,28.23) 65.26,28.23 ; 65.26,28.23 65.48,28.01 65.48,26.82 ; 63.25,15.09 60.63,12.47 59.56,12.47 ; 65.89,15.75 65.89,16.8 C70.2 ; v1(61.71,26.82) U34.11
  Inner2 w0.28: v1(64.27,28.23) 64.27,27.57 63.61,26.91 63.61,24.93 ; 63.61,24.93 v1(66.38,24.93) ; 63.61,24.93 v1(62.45,23.77)
  Inner2 w0.33: v1(61.71,26.82) 61.8,26.91 63.61,26.91
DO_PROBE_SIGNAL: length 8.9
  Top Layer w0.33: 62.1,9.93 60.45,9.93 58.47,11.91 58.47,13.84 R72.1 R73.2
DTR: length 9.7
  Top Layer w0.28: v1(13.86,43.04) 13.86,42.05 12.9,41.09 U8.28
  Top Layer w0.33: Q2.2 11.37,46.18 v1(11.55,46.01) ; R5.1 14.62,43.04 v1(13.86,43.04)
  Inner1 w0.33: v1(13.86,43.04) 13.86,43.7 v1(11.55,46.01)
ESP32_EN: length 34.9
  Top Layer w0.33: Q1.3 10.35,42.08 R7.1 10.02,42.4 C17.2 8.43,42.4 v1(7.71,41.68) ; v1(3.62,62.93) 3.62,63.59 2.96,64.25 2.34,64.25 U1.3 ; v1(4.41,41.68) Reset.2
  Inner1 w0.33: v1(7.71,41.68) v1(4.41,41.68)
  Bottom Layer w0.33: v1(3.62,62.93) 4.41,62.14 v1(4.41,41.68)
GPIO_0: length 23.7
  Top Layer w0.33: Q2.3 11.99,45.33 11.79,45.33 ; U1.27 19.8,49.04 18.72,47.97 12.78,47.97 12.45,47.64 12.45,45.99 11.79,45.33 ; 11.79,45.33 11.13,45.33 10.91,45.11 10.36,45.11 R9.1 10.02,45.45 8.76,45.45 7.77,44.46 2.85,44.46 Boot.2
LIMITSW: length 35.3
  Top Layer w0.33: U12.1 50.42,65.92 C37.2 49.26,63.05 R34.1 24.01,62.88 21.61,60.48 U1.35
LOGO_B: length 48.9
  Top Layer w0.33: R114.1 62.13,56.63 v1(53.06,56.63) ; U1.25 16.76,49.7 v1(18.41,51.35)
  Bottom Layer w0.33: v1(53.06,56.63) 47.78,51.35 v1(18.41,51.35)
LOGO_G: length 49.2
  Top Layer w0.33: U1.24 15.49,49.7 v1(18.46,52.67) ; v1(53.32,54.19) R113.1
  Inner2 w0.33: v1(53.32,54.19) 19.99,54.19 v1(18.46,52.67)
LOGO_R: length 49.6
  Top Layer w0.33: v1(15.87,51.02) 15.54,51.02 14.22,49.7 U1.23 ; v1(55.14,51.35) 62.07,51.35 R115.1
  Inner2 w0.33: v1(55.14,51.35) 19.5,51.35 18.84,50.69 16.2,50.69 v1(15.87,51.02)
NEOPIXEL: length 55.4
  Top Layer w0.33: U1.22 12.95,49.7 13.61,50.36 v1(13.94,50.36) ; v1(58.37,39.59) R107.1
  Inner1 w0.33: v1(58.37,39.59) 24.71,39.59 v1(13.94,50.36)
ORP_ISOLATED_+5V: length 44.6
  Top Layer w0.28: 48.55,25.16 49.21,25.16 49.43,24.94 49.43,24.61 ; 48.55,25.16 U30.1 ; 48.55,25.16 48.39,25.32 U30.15 ; v1(44.72,20.99) 44.4,20.67 R97.1 ; U29.6 50.09,21.16 50.09,22.19 50.75,22.85 ; 49.43,24.61 49.43,23.95 48.89,23.41 U30.7 ; 49.43,24.61 50.09,24.61 50.42,24.28 ; 50.42,24.28 50.17,24.28 U30.10 ; 50.42,24.28 50.75,23.95 50.75,22.85 ; 50.75,22.85 51.08,23.18 51.08,23.84 50.75,24.17 50.75,29.12 49.87,29.99 47.09,29.99 46.76,29.66 46.1,29.66
  Top Layer w0.33: 45.77,33.45 45.77,32.84 45.83,32.79 C97.2 C103.2 45.88,30.11 R91.2 46.1,29.66 46.1,28.93 R92.2 45.77,27.72 C100.2 v1(45.38,26.67) C99.2 ; 45.77,33.45 47.42,33.45 47.58,33.29 U31.12 ; 45.77,33.45 R90.2 45.77,35.47 C98.2 ; 48.55,29.99 U31.17 ; 51.08,23.18 52.56,21.7 C101.2
  Inner2 w0.28: v1(45.38,26.67) 45.71,26.34 45.71,21.98 v1(44.72,20.99)
ORP_ISOLATED_GND: length 59.7
  Top Layer w0.28: v1(48.7,27.42) 47.89,26.62 U30.16 46.9,25.81 46.57,25.48 46.57,25.15 ; C105.1 44.91,25.15 46.57,25.15 ; U29.3 50.17,17.13 50.55,17.51 52.53,17.51 56.16,21.14 56.16,22.13 C106.1 ; 47.23,24.33 U30.3 ; 47.23,24.33 U30.2 46.74,24.66 46.57,24.82 46.57,25.15 ; 47.23,24.33 47.46,24.33 48.39,23.39 U30.6 ; v1(52.66,23.79) 52.66,22.84 C101.1
  Top Layer w0.33: 49.96,31 50.06,31.09 50.06,31.56 49.63,31.99 ; 49.96,31 v1(50.29,30.67) ; 49.96,31 49.65,30.69 U31.16 ; 49.2,34.67 46.23,37.64 45.24,37.64 44.91,37.31 44.91,36.98 44.79,36.87 44.79,35.58 44.13,34.92 44.13,33.45 44.79,32.79 44.79,31.39 ; 49.2,34.67 50.19,33.68 50.19,32.54 49.63,31.99 ; 49.2,34.67 49.2,34.49 U31.11 ; R98.2 44.29,23.25 C105.1 ; C100.1 44.29,25.79 44.92,25.15 ; 49.63,31.99 U31.14 ; U31.20 48.7,28.03 v1(48.7,27.42) ; C106.1 54.83,23.46 52.99,23.46 52.66,23.13
  Inner1 w0.28: v1(52.66,23.79) 49.03,27.42 v1(48.7,27.42)
  Inner2 w0.33: v1(48.7,27.42) 48.7,27.75 50.29,29.35 v1(50.29,30.67)
ORP_PROBE_GND: length 26.9
  Top Layer w0.33: v1(45.07,23.8) 45.07,23.33 R98.1 ; 45.44,13.92 45.44,13.26 U16.3 ; 45.44,13.92 44.12,13.92 43.46,14.58 43.46,19.53 43.62,19.68 44.78,19.68 45.11,20.01 45.11,20.19 R97.2 45.59,20.67 45.59,21.41 R93.2 ; 45.44,13.92 45.44,14.58 R96.1
  Inner2 w0.33: v1(45.07,23.8) 43.94,22.67 43.94,20.69 45.44,19.2 45.44,13.26 U16.3
ORP_PROBE_SIGNAL: length 8.1
  Top Layer w0.33: U16.2 44.88,11.28 46.33,11.28 47.63,12.57 U29.1
PH_ISOLATED_+5V: length 47.9
  Top Layer w0.28: 36.55,24.37 U27.11 36.69,24.37 ; 36.55,24.37 36.05,23.87 36.05,23.7 35.89,23.54 35.72,23.54 35.56,23.37 U27.7 ; 36.55,24.37 36.46,24.37 35.8,25.03 U27.1 ; 36.55,24.37 36.69,24.37 ; 37.02,24.37 36.69,24.37 ; 37.02,24.37 37.35,24.7 37.35,25.72 v1(37.2,25.87) ; 37.02,24.37 38.63,22.76 C64.2 ; 36.69,24.37 U27.10 ; v1(36.83,22.61) U26.6
  Top Layer w0.33: U28.12 35.66,32.91 36.14,32.42 36.14,29.5 ; 31.59,23.14 31.59,24.53 31.52,24.6 v1(31.52,25.14) 31.19,25.47 R58.2 R57.2 31.08,27.19 31.08,30.9 R56.2 31.19,32.3 31.08,32.41 ; 36.14,29.5 35.81,29.5 35.66,29.65 U28.17 ; 36.14,29.5 36.47,29.5 37.53,28.45 37.53,26.2 v1(37.2,25.87) ; U26.6 36.83,20.25 34.13,17.55 R64.1
  Inner1 w0.28: v1(31.52,25.14) 35.29,25.14 35.55,24.88 35.88,24.88 ; 35.88,24.88 35.88,23.56 v1(36.83,22.61) ; 35.88,24.88 36.87,25.87 v1(37.2,25.87)
PH_ISOLATED_GND: length 62.7
  Top Layer w0.28: v1(39.92,20.62) 39.92,20.29 C85.1 ; 33.9,24.2 U27.3 ; 33.9,24.2 U27.2 33.17,24.53 32.91,24.79 ; 33.9,24.2 34.12,24.2 35.06,23.26 U27.6 ; 34.48,25.78 U27.16 U27.15 ; 34.48,25.78 33.57,25.78 32.91,25.12 32.91,24.79 ; 34.48,25.78 34.48,26.11 33.82,26.77 33.82,27.43 34.15,27.76 ; 32.91,24.79 C61.1
  Top Layer w0.33: 32.5,28.42 32.24,28.42 C80.1 ; 32.5,28.42 v1(32.5,29.08) 32.5,29.41 ; 32.5,28.42 33.16,27.76 34.61,27.76 U28.20 ; 32.5,29.41 33.39,30.3 ; 32.5,29.41 C57.1 ; 33.39,30.3 33.06,30.63 33.06,30.96 33.7,31.61 U28.14 ; 33.39,30.3 U28.16 ; v1(39.1,18.52) 39.1,14.23 38.44,13.57 37.78,13.57 36.83,14.52 U26.3 ; C59.1 31.81,32.76 v1(31.81,33.04) 31.19,33.66 R55.1 31.19,34.13 31.52,34.46 32.51,34.46 33.42,33.56 U28.11 ; C61.1 C60.1 32.68,22.81 32.35,22.48 32.02,22.48 31.69,22.15 31.69,21.84 31.59,21.74 31.59,20.46 31.7,20.34 ; C64.1 41.57,21.87 41.57,19.63 41.24,19.3 39.92,19.3 39.59,19.63 C85.1
  Inner1 w0.33: v1(31.81,33.04) 31.81,32.05 32.5,31.36 v1(32.5,29.08)
  Bottom Layer w0.28: v1(32.5,29.08) 33.82,27.76 33.82,26.77 39.92,20.67 v1(39.92,20.62)
  Bottom Layer w0.33: v1(39.1,18.52) 39.43,18.85 39.43,21.16
PH_PROBE_GND: length 19.5
  Top Layer w0.33: R65.1 32.56,20.14 31.7,19.28 31.7,17.55 30.71,16.56 30.71,13.43 31.37,12.77 32.03,12.77 R62.1 32.71,11.76 33.04,11.43 39.85,11.43 U16.1
PH_PROBE_SIGNAL: length 13
  Top Layer w0.33: U16.4 42.24,11.38 42.24,13.03 41.58,13.69 39.27,13.69 38.61,13.03 35.97,13.03 34.29,14.71 U26.1
RTS: length 11.3
  Top Layer w0.28: v1(14.67,45.07) 15.99,43.75 15.99,41.11 14.91,40.02 U8.24
  Top Layer w0.33: v1(14.67,45.07) 14.67,45.63 R6.1 ; v1(12.36,43.75) 11.7,43.75 Q1.2
  Bottom Layer w0.33: v1(14.67,45.07) 13.68,45.07 v1(12.36,43.75)
RXD0: length 26.5
  Top Layer w0.28: v1(14.52,51.19) 14.52,57.13 19.14,61.75 U1.36 ; U8.26 13.91,41.01 14.89,42 v1(15.23,42)
  Inner2 w0.28: v1(14.52,51.19) 14.85,50.86 14.85,50.2 13.91,49.26 13.91,44.64 15.23,43.32 v1(15.23,42)
SALINTIY_PROBE_ANALOG_OUT: length 40.5
  Top Layer w0.33: C69.2 30.66,44.78 R51.2 29.35,45.11 29.02,45.44 28.12,45.44 27.3,44.62 D7.1 25.73,43.63 21.07,48.3 v1(21.07,52.84) ; v1(6.92,57.79) 2.96,61.75 U1.5
  Bottom Layer w0.33: v1(6.92,57.79) 16.12,57.79 v1(21.07,52.84)
SALINTIY_PROBE_GND: length 47.5
  Top Layer w0.33: U22.6 35.52,34.92 v1(35.2,34.59) ; v1(38.17,37.56) 38.17,40.25 38.32,40.41
  Inner1 w0.33: v1(35.2,34.59) v1(38.17,37.56) 38.17,35.58 43.77,29.97 47.41,29.97 52.36,25.02 53.67,25.02 64.57,14.13 64.57,12.55 64.64,12.47
SALINTIY_PROBE_SIGNAL: length 57.6
  Top Layer w0.33: 29.83,32.94 v1(30.17,32.61) ; 29.83,32.94 27.98,31.09 R75.2 ; 29.83,32.94 29.83,35.25 U22.1
  Bottom Layer w0.33: 62.1,12.47 60.8,11.16 50.95,11.16 35.77,26.34 35.77,27 v1(30.17,32.61)
SCL: length 116.6
  Top Layer w0.33: v1(9.02,47.82) 7.37,47.82 6.71,48.48 6.71,48.94 U1.17 ; v1(51.82,26.44) 51.82,26.05 R88.1 ; R54.1 38.14,25.38 v1(38.72,25.38) ; v1(58.42,31.72) 58.42,29.91 57.25,28.73 U31.2 ; U34.2 67.43,35.43 66.18,36.67 v1(65.19,36.67) ; U28.2 42.4,28.24 v1(44.16,28.24) ; R102.1 v1(61.72,36.01)
  Inner2 w0.33: v1(51.82,26.44) 53.14,26.44 v1(58.42,31.72) 58.42,32.71 v1(61.72,36.01)
  Bottom Layer w0.33: v1(44.16,28.24) 43.94,28.02 42.18,28.02 ; 42.18,28.02 39.21,25.05 38.72,25.05 38.64,25.14 38.64,25.3 v1(38.72,25.38) 31.79,32.31 31.46,32.31 15.95,47.82 v1(9.02,47.82) ; 42.18,28.02 42.51,27.69 45.48,27.69 46.21,28.42 49.84,28.42 v1(51.82,26.44) ; U14.1 65.19,60.06 v1(65.19,36.67) 65.02,36.67 64.36,36.01 v1(61.72,36.01)
SDA: length 121
  Top Layer w0.33: v1(39.49,26.24) R53.1 ; R101.1 v1(60.98,36.67) ; U31.3 55.07,29.39 v1(54.71,29.74) ; U1.12 4.3,52.86 v1(6.82,50.33) ; v1(43.91,29) U28.3 ; v1(66.78,33.04) U34.3 ; R87.1 52.69,27.72 v1(53.39,28.42)
  Inner1 w0.33: v1(6.82,50.33) 7.48,49.67 9.13,49.67 30.91,27.89 37.84,27.89 v1(39.49,26.24) 39.61,26.36 40.93,26.36 43.58,29 v1(43.91,29) ; U14.2 61.98,58.84 61.98,36.67 ; 61.98,36.67 v1(60.98,36.67) 60.98,36.01 v1(54.71,29.74) v1(53.39,28.42) ; 61.98,36.67 63.15,36.67 v1(66.78,33.04)
  Bottom Layer w0.33: v1(43.91,29) 44.57,29 44.99,28.58 45.46,28.58 45.89,29 52.82,29 v1(53.39,28.42)
STEP_DISABLE: length 31.8
  Top Layer w0.28: v1(24.75,55.3) 25.65,54.39 U2.2 ; v1(23.38,56.8) 22.24,57.94 19.8,57.94 ; U3.2 45.95,54.23 v1(45.29,54.89)
  Inner2 w0.28: v1(23.38,56.8) 24.75,55.43 v1(24.75,55.3)
  Bottom Layer w0.28: v1(24.75,55.3) 25.82,54.23 44.63,54.23 v1(45.29,54.89)
STIRFAN: length 41.3
  Top Layer w0.33: U1.34 26.11,59.21 28.09,61.19 41.16,61.19 v1(41.18,61.21) ; 57.96,58.72 v1(58.62,58.72)
  Bottom Layer w0.33: v1(58.62,58.72) 58.29,59.05 43.35,59.05 v1(41.18,61.21)
TEMP_OUT: length 65.6
  Top Layer w0.33: v1(24.69,12.91) 25.26,12.34 ; 25.26,12.34 R82.1 ; 25.26,12.34 25.26,11.41 U24.4 ; 2.3,63.02 1.64,63.02 0.98,62.36 v1(0.98,58.73)
  Inner1 w0.33: v1(0.98,58.73) 0.98,50.48 25.02,26.44 25.02,13.24 v1(24.69,12.91)
TMC_UART: length 55.1
  Top Layer w0.28: v1(11.54,51.72) 11.21,52.05 7.58,52.05 2.96,56.67 U1.9 ; U3.14 50.49,50.29 v1(49.94,49.74) ; v1(31.13,50.07) 31.3,50.23 U2.14
  Top Layer w0.33: U1.9 2.1,56.87 R13.1
  Inner1 w0.28: v1(11.54,51.72) 13.19,51.72 13.52,52.05 29.15,52.05 v1(31.13,50.07)
  Bottom Layer w0.28: v1(31.13,50.07) 31.79,50.73 48.95,50.73 v1(49.94,49.74)
TXD0: length 27.1
  Top Layer w0.28: U8.25 14.41,40.47 v1(14.52,40.58) ; 19.8,63.02 19.14,63.02 13.86,57.74 v1(13.86,52.79)
  Inner2 w0.28: v1(14.52,40.58) 13.2,41.9 13.2,52.13 v1(13.86,52.79)
U2_DIAG: length 27
  Top Layer w0.28: 7.87,49.04 7.87,49.46 9.11,50.69 v1(9.11,51.35) ; v1(29.57,48.51) 29.9,48.84 R14.1 29.8,49.27 U2.11
  Bottom Layer w0.28: v1(9.11,51.35) 11.09,49.37 28.71,49.37 v1(29.57,48.51)
U2_DIR: length 27.4
  Top Layer w0.28: U1.21 11.68,49.7 13,51.02 v1(13,53) ; U2.19 32.87,53.89 33.37,54.39 v1(33.37,54.88)
  Inner1 w0.28: v1(13,53) 13.9,53.89 32.38,53.89 v1(33.37,54.88)
U2_STEP: length 27.6
  Top Layer w0.28: v1(12.39,52.34) 12.39,51.68 10.41,49.7 U1.20 ; v1(33.13,52.39) U2.16
  Inner2 w0.28: v1(33.13,52.39) 32.8,52.06 17.95,52.06 16.35,53.66 12.72,53.66 12.39,53.33 v1(12.39,52.34)
U3_DIAG: length 44.8
  Top Layer w0.28: R15.1 v1(48.95,49.45) 48.95,50.69 U3.11
  Top Layer w0.33: U1.19 9.14,49.7 10.46,51.02 v1(10.79,51.02)
  Bottom Layer w0.33: v1(48.95,49.45) 48.54,49.04 30.06,49.04 29.07,50.03 17.85,50.03 15.87,52.01 14.22,52.01 13.23,51.02 v1(10.79,51.02)
U3_DIR: length 37
  Top Layer w0.28: v1(23.1,55.02) 21.45,56.67 U1.32 ; U3.19 52.15,53.73 v1(52.44,53.44)
  Inner1 w0.28: v1(52.44,53.44) 45.47,53.44 42.21,56.69 34.01,56.69 31.68,54.36 23.76,54.36 v1(23.1,55.02)
U3_STEP: length 37.5
  Top Layer w0.28: v1(23.1,52.76) 20.46,55.4 U1.31 ; U3.16 52.15,52.23 v1(52.28,52.36)
  Inner1 w0.28: v1(23.1,52.76) 31.68,52.76 35.31,49.13 47.85,49.13 48.18,49.46 48.18,49.79 50.75,52.36 v1(52.28,52.36)
$1N3129: length 12.8
  Top Layer w0.4: v1(26.31,56.88) 27.3,55.89 27.3,54.9
  Inner1 w0.5: U7.4 26.31,64.07 v1(26.31,56.88)
$1N3140: length 11.8
  Top Layer w0.4: U2.26 29.3,56.56 v1(29.54,56.8)
  Bottom Layer w0.5: U7.3 29.54,63.34 v1(29.54,56.8)
$1N3174: length 10.9
  Top Layer w0.4: U2.24 v1(30.3,56.95)
  Inner1 w0.5: v1(30.3,56.95) 30.3,65.08 U7.2
$1N3214: length 11.7
  Top Layer w0.4: 32.3,54.9 v1(32.3,55.89)
  Inner2 w0.5: v1(32.3,55.89) 32.3,65.58 U7.1
$1N3223: length 2.3
  Top Layer w0.28: 30.8,55.89 30.8,56.6 31.08,56.88 31.08,57.6 R86.1
$1N3232: length 2
  Top Layer w0.3: R85.1 28.83,55.89
$1N3463: length 2.9
  Top Layer w0.28: U2.4 25.15,53.39 C4.1
$1N3468: length 2.7
  Top Layer w0.28: C4.2 24.71,52.89 U2.5
$1N3475: length 2.7
  Top Layer w0.28: U2.6 26.12,52.39 C5.2
$1N3592: length 1.7
  Top Layer w0.28: U2.8 27.56,50.16 C66.2
$1N4497: length 15.3
  Top Layer w0.4: U3.1 46.49,55.06 v1(45.5,56.05)
  Bottom Layer w0.5: v1(45.5,56.05) 37.52,64.03 U9.4
$1N4503: length 14.1
  Top Layer w0.4: U3.26 v1(48.49,56.72)
  Inner2 w0.5: v1(48.49,56.72) 48.49,57.85 U9.3
$1N4505: length 13.5
  Top Layer w0.4: U3.24 49.49,56.39 49.16,56.72 v1(49.16,58.37)
  Inner2 w0.5: v1(49.16,58.37) 49.16,59.68 U9.2
$1N4509: length 15
  Top Layer w0.4: U3.21 52.32,55.57 52.32,58.52 v1(50.83,60.01)
  Bottom Layer w0.5: U9.1 50.83,60.51 v1(50.83,60.01)
$1N4513: length 2.1
  Top Layer w0.28: U3.23 49.99,57.77 R84.1
$1N4515: length 2.4
  Top Layer w0.28: R83.1 47.66,57.47 47.66,56.72 47.99,56.39 U3.27
$1N4529: length 2.5
  Top Layer w0.28: U3.4 44.37,53.23 C11.1
$1N4533: length 2.5
  Top Layer w0.28: 46.49,52.73 44.36,52.73 C11.2
$1N4535: length 2.5
  Top Layer w0.28: C12.2 45.77,52.23 U3.6
$1N4539: length 2.1
  Top Layer w0.28: C67.2 46.48,49.72 U3.8
$1N5397: length 1.5
  Top Layer w0.33: R5.2 14.67,44.08 Q1.1
$1N5412: length 1.7
  Top Layer w0.33: Q2.1 14.55,47 R6.2
$1N5842: length 1.7
  Top Layer w0.33: Reset.1 6.9,42.52 R8.2
$1N6131: length 1.3
  Top Layer w0.33: R10.2 6.14,45.69 Boot.1
$1N6975: length 2.3
  Top Layer w0.3: USB1.4 6.97,35.84 R12.2
$1N6980: length 2.8
  Top Layer w0.3: USB1.10 8.43,32.82 R11.2
$1N7020: length 20.6
  Top Layer w0.28: U8.4 11.25,37.1 11.11,37.23 11.11,37.69 v1(10.92,37.89)
  Top Layer w0.3: v1(5.64,33.82) USB1.8 ; D2.2 8.57,34.77 v1(8.24,34.77) 6.99,34.77 USB1.6
  Inner2 w0.28: v1(12.2,33.78) 11.58,34.41 11.58,38.88 v1(10.82,39.64)
  Bottom Layer w0.28: v1(10.92,37.89) 10.82,37.99 v1(10.82,39.64) ; v1(12.2,33.78) 11.21,33.78 10.22,34.77 v1(8.24,34.77)
  Bottom Layer w0.3: v1(8.24,34.77) 6.59,34.77 v1(5.64,33.82)
$1N7024: length 9.9
  Top Layer w0.28: 11.91,36.6 11.21,36.6 v1(10.92,36.3) ; D1.2 v1(9.56,33.96)
  Top Layer w0.3: USB1.5 6.94,35.31 6.29,35.31 5.96,34.98 5.96,34.65 6.29,34.32 USB1.7 6.98,34.29 7.64,34.29 8.63,33.3 D1.2
  Inner1 w0.28: v1(9.56,33.96) 9.56,34.95 v1(10.92,36.3)
$1N8939: length 1.6
  Top Layer w0.33: R16.2 7.21,12.21 U4.4
$1N8973: length 2
  Top Layer w0.33: C25.1 2.61,11.42 U4.1
$1N9009: length 22.2
  Top Layer w0.33: L1.1 11.56,26.06 D4.1 8.73,26.02 v1(8.73,20.68) ; 0.89,12.51 v1(1.88,13.5) ; v1(2.79,14.74) U4.8
  Bottom Layer w0.33: v1(8.73,20.68) v1(2.79,14.74) 2.79,14.41 v1(1.88,13.5)
$1N9024: length 5.2
  Top Layer w0.33: C26.2 8.22,18.41 ; 8.22,18.41 8.22,17.82 R17.2 ; 8.22,18.41 7.89,18.74 6.6,18.74 5.33,17.47 U4.6
$1N9059: length 1.3
  Top Layer w0.33: R17.1 9.18,17.69 C27.2
$1N9203: length 5
  Top Layer w0.33: U4.5 6.6,16.69 7.5,15.8 8.48,15.8 8.81,15.47 R18.1 8.81,13.73 R19.2
$1N9689: length 2.3
  Top Layer w0.33: R68.2 1.14,15.06 LED1.2
$1N11611: length 2.2
  Top Layer w0.33: R32.1 20.23,19.93 19.29,20.87 U11.8
$1N17900: length 7.9
  Top Layer w0.33: Q3.3 61.37,65.98 U13.2
$1N18080: length 1.5
  Top Layer w0.33: Q3.1 58.09,59.72 R35.1
$1N18654: length 1.6
  Top Layer w0.33: R13.2 2.09,57.73 2.3,57.94
$1N35150: length 1.9
  Top Layer w0.33: R72.2 60.7,15.2 U17.3
$1N35249: length 8
  Top Layer w0.33: U17.4 64.42,15.53 v1(63.76,16.19) ; R71.1 v1(61.52,20.62) R70.2
  Inner1 w0.33: v1(63.76,16.19) 63.76,17.72 R71.1 v1(61.52,20.62)
$1N35264: length 3.3
  Top Layer w0.33: U17.1 60.65,18.27 R74.1 R71.2
$1N36630: length 3.6
  Top Layer w0.33: R41.2 22.09,26.06 22.83,26.79 U19.11
$1N36635: length 4.2
  Top Layer w0.33: U19.10 21.23,28.38 v1(21.23,27.71) ; R42.1 v1(19.5,26.06)
  Inner1 w0.33: v1(21.23,27.71) 19.58,26.06 v1(19.5,26.06)
$1N36712: length 5.6
  Top Layer w0.33: U19.9 20.29,28.38 v1(19.63,27.72) ; C68.1 20,25.08 v1(19.3,25.08)
  Bottom Layer w0.33: v1(19.3,25.08) 18.64,25.74 18.64,26.73 v1(19.63,27.72)
$1N36717: length 3.7
  Top Layer w0.33: 21.1,26.92 20.77,26.59 20.77,25.6 21.34,25.03 C68.2 ; 21.1,26.92 R41.1 ; 21.1,26.92 R42.2
$1N37096: length 3.9
  Top Layer w0.33: R63.1 20.33,32.36 21.55,33.58 U19.7
$1N37166: length 17.4
  Top Layer w0.33: v1(25.83,36.9) 26.48,37.56 29.13,37.56 30.45,36.24 U22.2 ; 17.58,31.09 17.58,31.3 17.98,31.7 ; v1(21.54,32.61) 20.62,31.7 17.98,31.7 ; 17.98,31.7 17.58,32.09 17.58,32.36
  Inner2 w0.33: v1(25.83,36.9) v1(21.54,32.61)
$1N37655: length 2.6
  Top Layer w0.33: C95.2 23.62,43.74 U20.2
$1N37665: length 2.5
  Top Layer w0.33: C95.1 21.08,43.97 U20.4
$1N37927: length 7.5
  Top Layer w0.33: R108.1 R81.2 37.99,41.27 37.45,40.74 37.45,36.57 U22.7
$1N37931: length 8
  Top Layer w0.33: v1(38.97,43.44) 38.33,43.44 R108.2 ; v1(36.13,44.1) R109.1 36.06,43.38 R110.1 35.52,42.67 U22.9
  Inner2 w0.33: v1(36.13,44.1) 36.79,43.44 v1(38.97,43.44)
$1N38275: length 3.3
  Top Layer w0.33: R110.2 R111.1 33.12,43.97 D5.2
$1N38280: length 6.6
  Top Layer w0.33: v1(37.44,41.68) 37.03,41.68 U22.8 ; D6.2 36.59,44.98 D5.1 v1(34.8,44.32)
  Bottom Layer w0.33: v1(34.8,44.32) v1(37.44,41.68)
$1N38302: length 11.6
  Top Layer w0.33: R109.2 37.59,44.04 v1(37.59,44.37) 37.92,44.37 38.58,45.03 D6.1 ; U22.12 31.05,42.11 v1(31.05,42.72)
  Inner1 w0.33: v1(31.05,42.72) 35.94,42.72 v1(37.59,44.37)
$1N38327: length 3.4
  Top Layer w0.33: U22.13 30.24,41.65 R112.1 R111.2
$1N38343: length 3.8
  Top Layer w0.33: R51.1 28.49,44.27 R112.2 29.38,41.65 U22.14
$1N62263: length 5.3
  Top Layer w0.33: 33.05,32.15 33.05,32 R56.1 ; 33.05,32.15 33.05,32.81 R55.2 ; 33.05,32.15 34.57,32.15 U28.13
$1N62345: length 8
  Top Layer w0.28: 35.69,27.07 35.56,26.94 U27.14
  Top Layer w0.33: R57.1 v1(33.05,27.07) ; v1(34.7,26.74) 35.03,27.07 35.69,27.07 36.11,27.5 36.11,27.97 35.73,28.35 U28.19
  Inner1 w0.33: v1(33.05,27.07) 34.37,27.07 v1(34.7,26.74)
$1N62354: length 9.9
  Top Layer w0.28: U28.18 35.99,29 v1(36.27,28.73) ; R58.1 v1(32.72,25.8) ; v1(36.6,26.46) 36.6,26.23 U27.13
  Inner1 w0.28: v1(32.72,25.8) 35.94,25.8 v1(36.6,26.46)
  Inner2 w0.28: v1(36.27,28.73) 36.6,28.4 v1(36.6,26.46)
$1N63063: length 6.4
  Top Layer w0.28: R60.1 40.57,21.69 40.23,22.02 38.58,22.02 37.27,23.34 36.9,23.34 U27.9
  Top Layer w0.33: R60.1 40.57,20.07 C85.2
